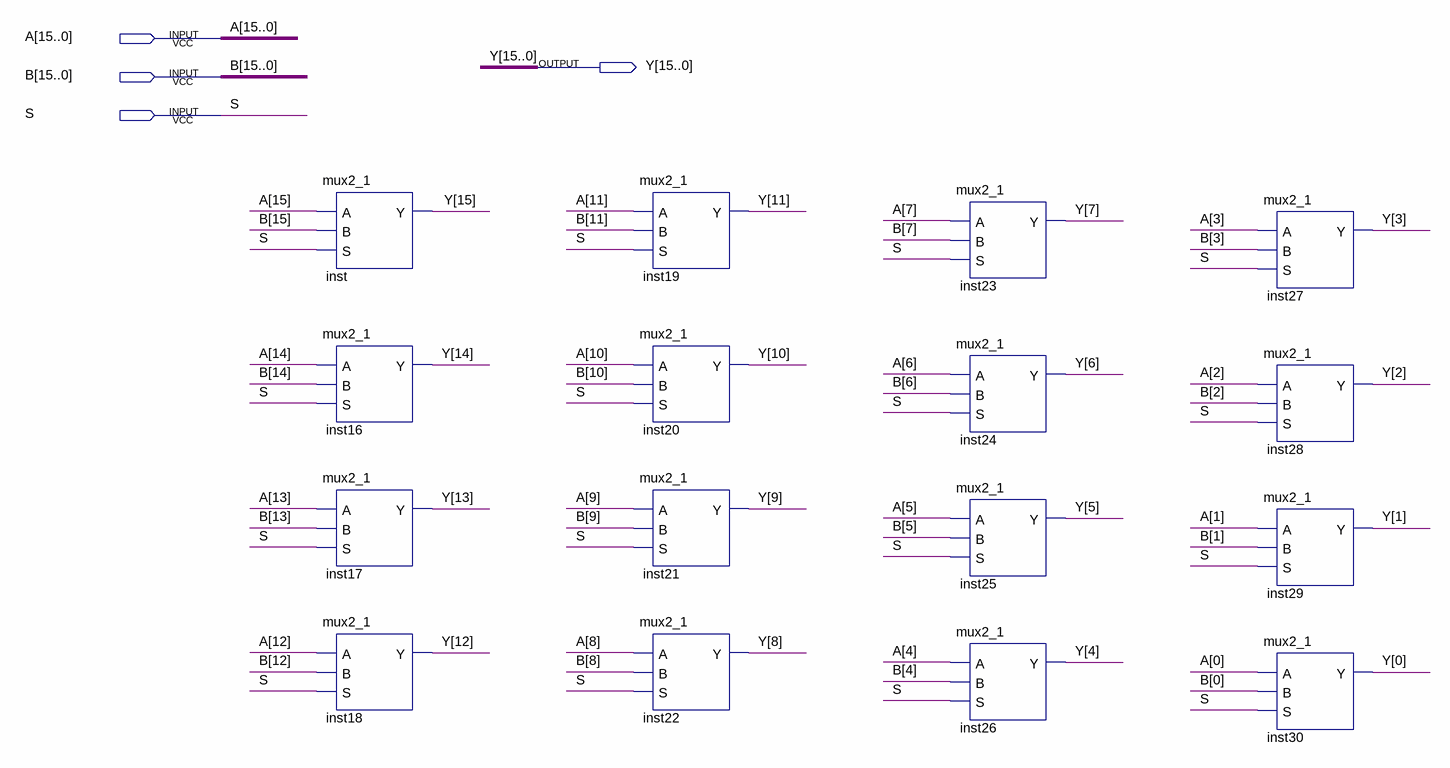
[diagram p0: schematic sheet]
// Quartus schematic mux2_1_16bit.bdf as structural Verilog: 16 symbols, 4 pins
module mux2_1_16bit (
  input  [15:0] A,
  input  [15:0] B,
  input  S,
  output [15:0] Y
);

  mux2_1 inst (.A(A[15]), .B(B[15]), .S(S), .Y(Y[15]));
  mux2_1 inst16 (.A(A[14]), .B(B[14]), .S(S), .Y(Y[14]));
  mux2_1 inst17 (.A(A[13]), .B(B[13]), .S(S), .Y(Y[13]));
  mux2_1 inst18 (.A(A[12]), .B(B[12]), .S(S), .Y(Y[12]));
  mux2_1 inst19 (.A(A[11]), .B(B[11]), .S(S), .Y(Y[11]));
  mux2_1 inst20 (.A(A[10]), .B(B[10]), .S(S), .Y(Y[10]));
  mux2_1 inst21 (.A(A[9]), .B(B[9]), .S(S), .Y(Y[9]));
  mux2_1 inst22 (.A(A[8]), .B(B[8]), .S(S), .Y(Y[8]));
  mux2_1 inst23 (.A(A[7]), .B(B[7]), .S(S), .Y(Y[7]));
  mux2_1 inst24 (.A(A[6]), .B(B[6]), .S(S), .Y(Y[6]));
  mux2_1 inst25 (.A(A[5]), .B(B[5]), .S(S), .Y(Y[5]));
  mux2_1 inst26 (.A(A[4]), .B(B[4]), .S(S), .Y(Y[4]));
  mux2_1 inst27 (.A(A[3]), .B(B[3]), .S(S), .Y(Y[3]));
  mux2_1 inst28 (.A(A[2]), .B(B[2]), .S(S), .Y(Y[2]));
  mux2_1 inst29 (.A(A[1]), .B(B[1]), .S(S), .Y(Y[1]));
  mux2_1 inst30 (.A(A[0]), .B(B[0]), .S(S), .Y(Y[0]));
endmodule
